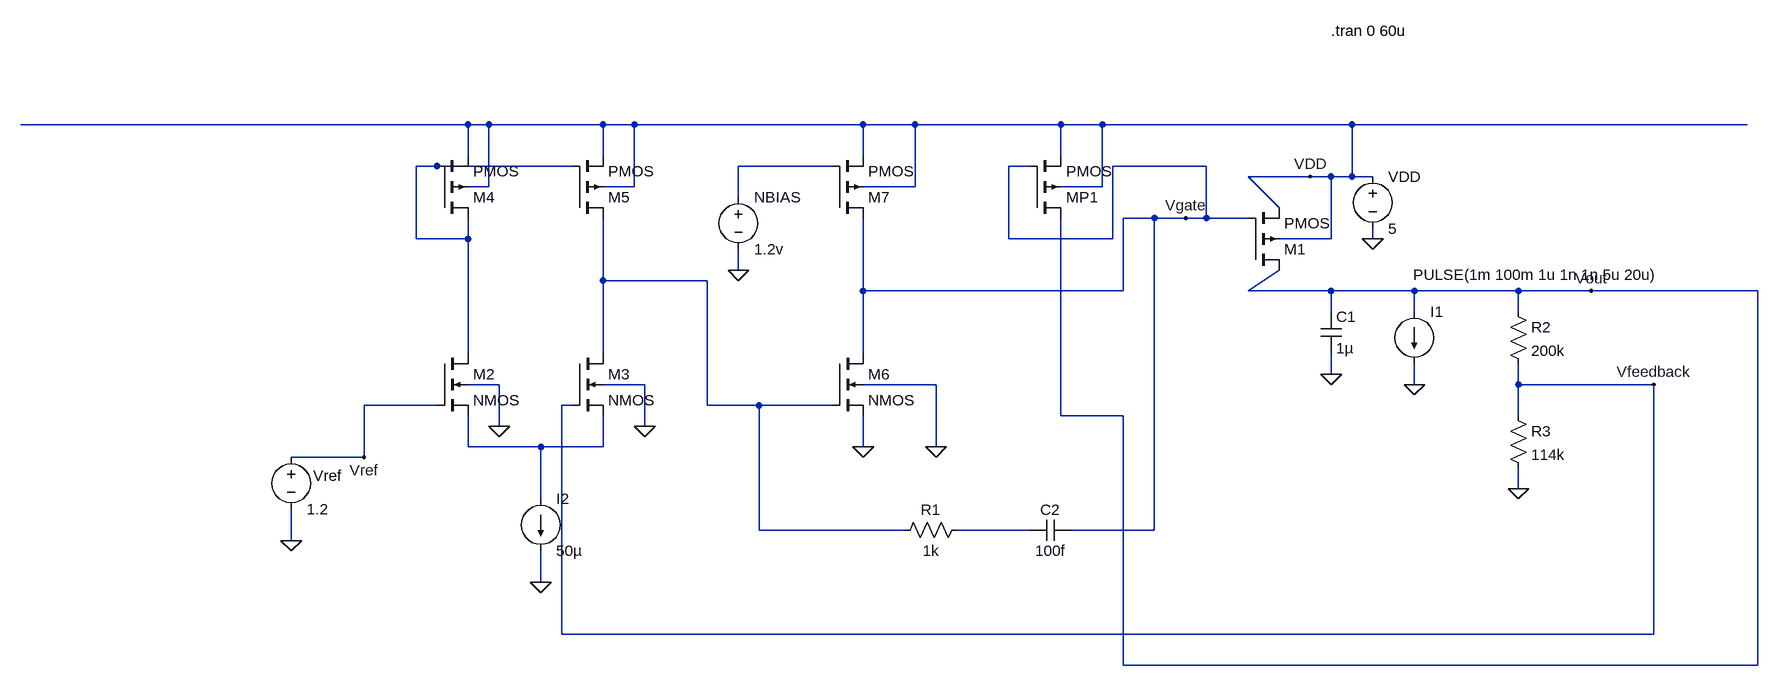
[diagram p0: schematic LDO_Final.asc]
LDO_Final.asc, the LTspice schematic file:
Version 4.1
SHEET 1 2020 1332
WIRE -496 -32 -1184 -32
WIRE -464 -32 -496 -32
WIRE -288 -32 -464 -32
WIRE -240 -32 -288 -32
WIRE 112 -32 -240 -32
WIRE 192 -32 112 -32
WIRE 416 -32 192 -32
WIRE 480 -32 416 -32
WIRE 864 -32 480 -32
WIRE 1472 -32 864 -32
WIRE -496 16 -496 -32
WIRE -288 16 -288 -32
WIRE 112 16 112 -32
WIRE 416 16 416 -32
WIRE -544 32 -576 32
WIRE -336 32 -544 32
WIRE 64 32 -80 32
WIRE 368 32 336 32
WIRE 640 32 496 32
WIRE 800 48 704 48
WIRE 832 48 800 48
WIRE 864 48 864 -32
WIRE 864 48 832 48
WIRE 896 48 864 48
WIRE -464 64 -464 -32
WIRE -464 64 -496 64
WIRE -240 64 -240 -32
WIRE -240 64 -288 64
WIRE 192 64 192 -32
WIRE 192 64 112 64
WIRE 480 64 480 -32
WIRE 480 64 416 64
WIRE -80 80 -80 32
WIRE 752 96 704 48
WIRE 560 112 512 112
WIRE 608 112 560 112
WIRE 640 112 640 32
WIRE 640 112 608 112
WIRE 704 112 640 112
WIRE -576 144 -576 32
WIRE -496 144 -496 112
WIRE -496 144 -576 144
WIRE 336 144 336 32
WIRE 496 144 496 32
WIRE 496 144 336 144
WIRE 832 144 832 48
WIRE 832 144 752 144
WIRE 896 144 896 128
WIRE -80 192 -80 160
WIRE -288 208 -288 112
WIRE -128 208 -288 208
WIRE 112 224 112 112
WIRE 512 224 512 112
WIRE 512 224 112 224
WIRE 704 224 752 192
WIRE 832 224 704 224
WIRE 960 224 832 224
WIRE 1120 224 960 224
WIRE 1232 224 1120 224
WIRE 1488 224 1232 224
WIRE 832 256 832 224
WIRE 960 256 960 224
WIRE 1120 256 1120 224
WIRE -496 320 -496 144
WIRE -288 320 -288 208
WIRE 112 320 112 224
WIRE 832 352 832 320
WIRE -448 368 -496 368
WIRE -224 368 -288 368
WIRE 224 368 112 368
WIRE 960 368 960 336
WIRE 1120 368 1120 336
WIRE 1328 368 1120 368
WIRE -544 400 -656 400
WIRE -336 400 -352 400
WIRE -128 400 -128 208
WIRE -48 400 -128 400
WIRE 64 400 -48 400
WIRE 416 416 416 112
WIRE 512 416 416 416
WIRE 1120 416 1120 368
WIRE -448 432 -448 368
WIRE -224 432 -224 368
WIRE -496 464 -496 416
WIRE -384 464 -496 464
WIRE -288 464 -288 416
WIRE -288 464 -384 464
WIRE 112 464 112 416
WIRE 224 464 224 368
WIRE -656 480 -656 400
WIRE -656 480 -768 480
WIRE 1120 528 1120 496
WIRE -384 544 -384 464
WIRE -48 592 -48 400
WIRE 176 592 -48 592
WIRE 368 592 256 592
WIRE 560 592 560 112
WIRE 560 592 432 592
WIRE -768 608 -768 560
WIRE -384 672 -384 624
WIRE -352 752 -352 400
WIRE 1328 752 1328 368
WIRE 1328 752 -352 752
WIRE 512 800 512 416
WIRE 1488 800 1488 224
WIRE 1488 800 512 800
FLAG 896 144 0
FLAG 832 352 0
FLAG 960 368 0
FLAG 1120 528 0
FLAG 800 48 VDD
FLAG 1232 224 Vout
FLAG 1328 368 Vfeedback
FLAG 608 112 Vgate
FLAG -768 608 0
FLAG -656 480 Vref
FLAG -384 672 0
FLAG -224 432 0
FLAG -448 432 0
FLAG -80 192 0
FLAG 112 464 0
FLAG 224 464 0
SYMBOL voltage 896 32 R0
WINDOW 123 0 0 Left 0
WINDOW 39 0 0 Left 0
SYMATTR InstName VDD
SYMATTR Value 5
SYMBOL cap 816 256 R0
SYMATTR InstName C1
SYMATTR Value 1µ
SYMBOL res 1104 240 R0
SYMATTR InstName R2
SYMATTR Value 200k
SYMBOL res 1104 400 R0
SYMATTR InstName R3
SYMATTR Value 114k
SYMBOL pmos4 704 192 M180
SYMATTR InstName M1
SYMATTR Value2 l=1u w=200u
SYMBOL voltage -768 464 R0
WINDOW 123 0 0 Left 0
WINDOW 39 0 0 Left 0
WINDOW 0 34 44 Left 2
SYMATTR InstName Vref
SYMATTR Value 1.2
SYMBOL current 960 256 R0
WINDOW 3 -2 -57 Left 2
WINDOW 123 0 0 Left 0
WINDOW 39 0 0 Left 0
SYMATTR Value PULSE(1m 100m 1u 1n 1n 5u 20u)
SYMATTR InstName I1
SYMBOL pmos4 -544 112 M180
SYMATTR InstName M4
SYMATTR Value2 l=1u w=10u
SYMBOL pmos4 -336 112 M180
SYMATTR InstName M5
SYMATTR Value2 l=1u w=10u
SYMBOL nmos4 -544 320 R0
SYMATTR InstName M2
SYMATTR Value2 l=1u w=10u
SYMBOL nmos4 -336 320 R0
SYMATTR InstName M3
SYMATTR Value2 l=1u w=10u
SYMBOL current -384 544 R0
WINDOW 123 0 0 Left 0
WINDOW 39 0 0 Left 0
SYMATTR InstName I2
SYMATTR Value 50µ
SYMBOL nmos4 64 320 R0
SYMATTR InstName M6
SYMATTR Value2 l=1u w=20u
SYMBOL pmos4 64 112 M180
SYMATTR InstName M7
SYMATTR Value2 l=1u w=20u
SYMBOL voltage -80 64 R0
WINDOW 123 0 0 Left 0
WINDOW 39 0 0 Left 0
SYMATTR InstName NBIAS
SYMATTR Value 1.2v
SYMBOL res 272 576 R90
WINDOW 0 0 56 VBottom 2
WINDOW 3 32 56 VTop 2
SYMATTR InstName R1
SYMATTR Value 1k
SYMBOL cap 432 576 R90
WINDOW 0 0 32 VBottom 2
WINDOW 3 32 32 VTop 2
SYMATTR InstName C2
SYMATTR Value 100f
SYMBOL pmos4 368 112 M180
SYMATTR InstName MP1
SYMATTR Value2 l=1u w=200u
TEXT 832 -176 Left 2 !.tran 0 60u

The netlist it stands for:
* LDO_Final.asc
VDD VDD 0 5
C1 Vout 0 1µ
R2 Vout Vfeedback 200k
R3 Vfeedback 0 114k
M1 Vout Vgate VDD VDD PMOS l=1u w=200u
Vref Vref 0 1.2
I1 Vout 0 PULSE(1m 100m 1u 1n 1n 5u 20u)
M4 N001 N001 VDD VDD PMOS l=1u w=10u
M5 N003 N001 VDD VDD PMOS l=1u w=10u
M2 N001 Vref N004 0 NMOS l=1u w=10u
M3 N003 Vfeedback N004 0 NMOS l=1u w=10u
I2 N004 0 50µ
M6 Vgate N003 0 0 NMOS l=1u w=20u
M7 Vgate N002 VDD VDD PMOS l=1u w=20u
V§NBIAS N002 0 1.2v
R1 N005 N003 1k
C2 Vgate N005 100f
MP1 Vout Vgate VDD VDD PMOS l=1u w=200u
.model NMOS NMOS
.model PMOS PMOS
.lib standard.mos
.tran 0 60u
.backanno
.end